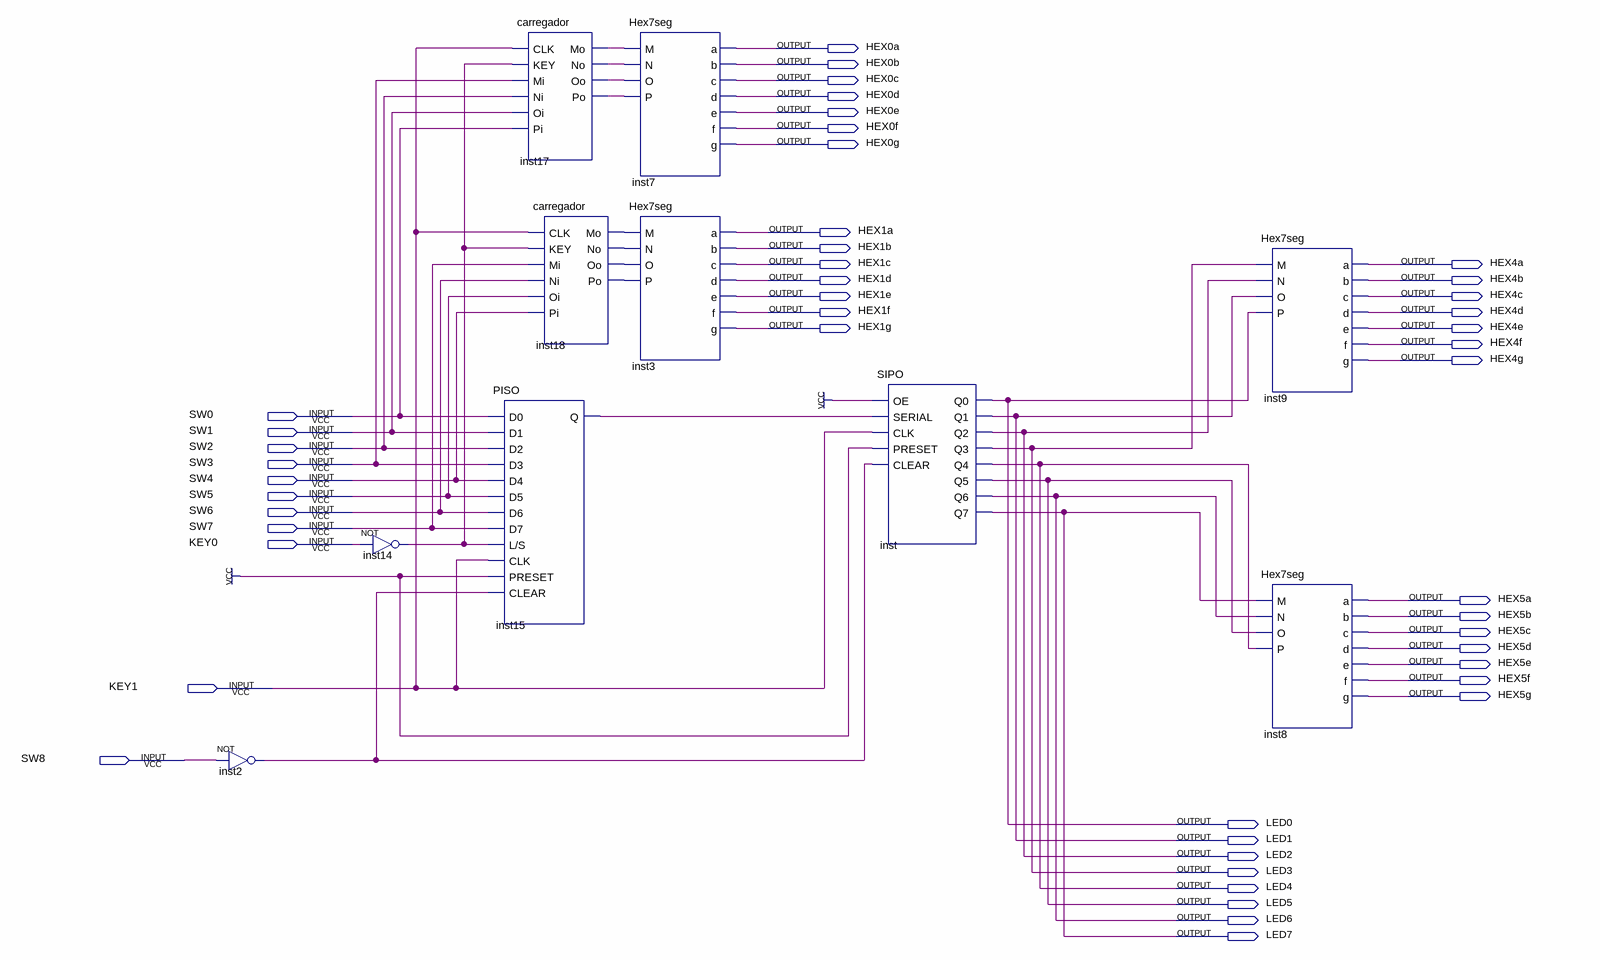
[diagram p0: schematic sheet]
// Quartus schematic Lab3.bdf as structural Verilog: 10 symbols, 47 pins
module Lab3 (
  input  SW0,
  input  SW1,
  input  SW2,
  input  SW3,
  input  SW4,
  input  SW5,
  input  SW6,
  input  SW7,
  input  KEY0,
  input  KEY1,
  input  SW8,
  output HEX0a,
  output HEX0b,
  output HEX0c,
  output HEX0d,
  output HEX0e,
  output HEX0f,
  output HEX0g,
  output HEX1a,
  output HEX1b,
  output HEX1c,
  output HEX4a,
  output HEX1d,
  output HEX4b,
  output HEX1e,
  output HEX4c,
  output HEX1f,
  output HEX4d,
  output HEX1g,
  output HEX4e,
  output HEX4f,
  output HEX4g,
  output HEX5a,
  output HEX5b,
  output HEX5c,
  output HEX5d,
  output HEX5e,
  output HEX5f,
  output HEX5g,
  output LED0,
  output LED1,
  output LED2,
  output LED3,
  output LED4,
  output LED5,
  output LED6,
  output LED7
);

  wire inst2_out, inst14_out, inst15_q, inst17_mo, inst17_no, inst17_oo, inst17_po, inst18_mo, inst18_no,
       inst18_oo, inst18_po;

  not inst2 (inst2_out, SW8);
  not inst14 (inst14_out, KEY0);
  PISO inst15 (
    .D0(SW0), .D1(SW1), .D2(SW2), .D3(SW3), .D4(SW4), .D5(SW5), .D6(SW6), .D7(SW7), .\L/S (inst14_out),
    .CLK(KEY1), .PRESET(1'b1), .CLEAR(inst2_out), .Q(inst15_q));
  carregador inst17 (
    .CLK(KEY1), .KEY(inst14_out), .Mi(SW3), .Ni(SW2), .Oi(SW1), .Pi(SW0), .Mo(inst17_mo), .No(inst17_no),
    .Oo(inst17_oo), .Po(inst17_po));
  carregador inst18 (
    .CLK(KEY1), .KEY(inst14_out), .Mi(SW7), .Ni(SW6), .Oi(SW5), .Pi(SW4), .Mo(inst18_mo), .No(inst18_no),
    .Oo(inst18_oo), .Po(inst18_po));
  Hex7seg inst7 (
    .M(inst17_mo), .N(inst17_no), .O(inst17_oo), .P(inst17_po), .a(HEX0a), .b(HEX0b), .c(HEX0c), .d(HEX0d),
    .e(HEX0e), .f(HEX0f), .g(HEX0g));
  Hex7seg inst3 (
    .M(inst18_mo), .N(inst18_no), .O(inst18_oo), .P(inst18_po), .a(HEX1a), .b(HEX1b), .c(HEX1c), .d(HEX1d),
    .e(HEX1e), .f(HEX1f), .g(HEX1g));
  SIPO inst (
    .OE(1'b1), .SERIAL(inst15_q), .CLK(KEY1), .PRESET(1'b1), .CLEAR(inst2_out), .Q0(LED0), .Q1(LED1),
    .Q2(LED2), .Q3(LED3), .Q4(LED4), .Q5(LED5), .Q6(LED6), .Q7(LED7));
  Hex7seg inst9 (
    .M(LED3), .N(LED2), .O(LED1), .P(LED0), .a(HEX4a), .b(HEX4b), .c(HEX4c), .d(HEX4d), .e(HEX4e), .f(HEX4f),
    .g(HEX4g));
  Hex7seg inst8 (
    .M(LED7), .N(LED6), .O(LED5), .P(LED4), .a(HEX5a), .b(HEX5b), .c(HEX5c), .d(HEX5d), .e(HEX5e), .f(HEX5f),
    .g(HEX5g));
endmodule
